# Altium schematic sheet SPSU_3.SchDoc: SPSU
size 292 x 217 mm; PCB_VERSION: V3.0; Origin: Eagle; Date: 12/02/2024 2:33:38 pm; SheetNumber: 4; SCHEMATIC_VERSION: SCHEMATIC_VERSION; GateName_1: G$1; SymbolName_1: A4L-LOC; LibraryName: frames_corvus; DeviceSetName: A4L-LOC; Sheet: Sheet:
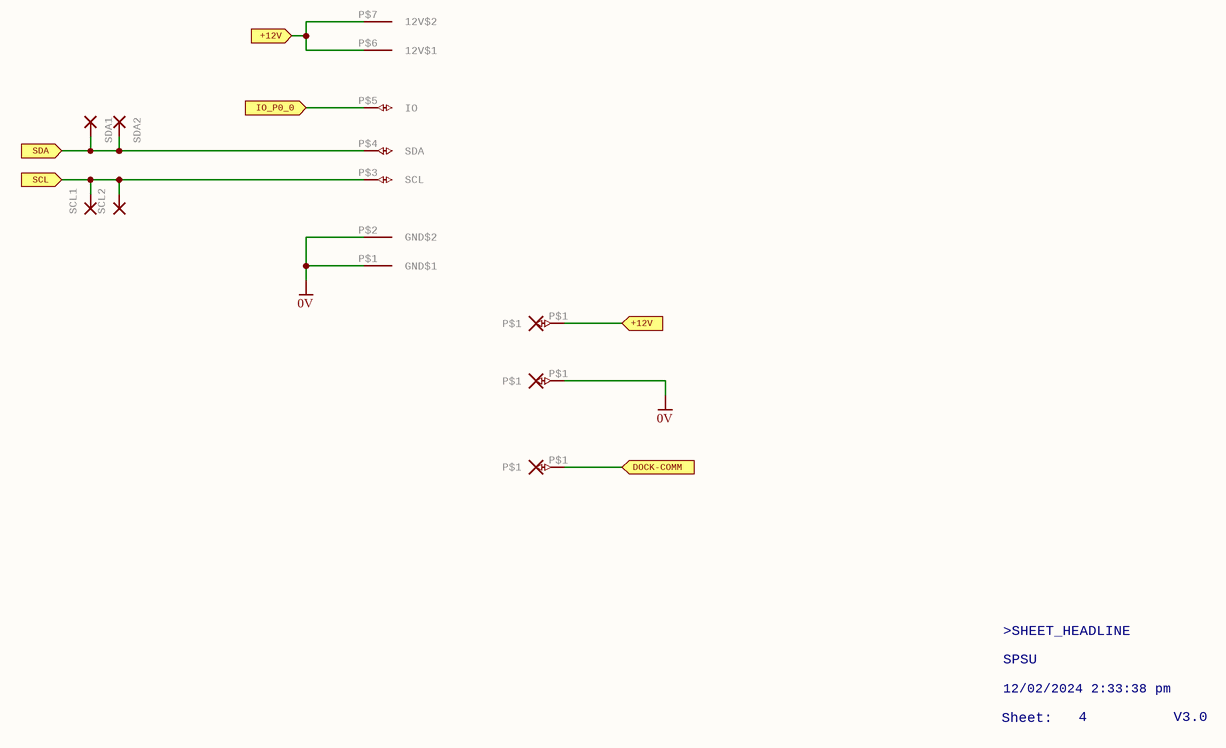
[diagram p0: SPSU_3.SchDoc]

## Parts
CHG+  SMT-PAD_SQ6MM  [SMT-PAD_SQ6MM]  (value not drawn)
CHG-  SMT-PAD_SQ6MM  [SMT-PAD_SQ6MM]  (value not drawn)
SCL1  1,6/0,8  [1,6/0,8]  (value not drawn)
SCL2  1,6/0,8  [1,6/0,8]  (value not drawn)
SDA1  1,6/0,8  [1,6/0,8]  (value not drawn)
SDA2  1,6/0,8  [1,6/0,8]  (value not drawn)
U$1  BATT_CON_THT  [BATT_CON_THT]  (value not drawn)
U$2  SMT-PAD_R3MM  [SMT-PAD_R3MM]  (value not drawn)

## Ports
+12V (in), DOCK-COMM (in), IO_P0_0 (in), SCL (in), SDA (in)

## Nets
0V: CHG-.P$1 U$1.P$1(GND$1) U$1.P$2(GND$2)
+12V: CHG+.P$1 U$1.P$6(12V$1) U$1.P$7(12V$2) ; port +12V
DOCK-COMM: U$2.P$1 ; port DOCK-COMM
IO_P0_0: U$1.P$5(IO) ; port IO_P0_0
SCL: SCL1.1(P) SCL2.1(P) U$1.P$3(SCL) ; port SCL
SDA: SDA1.1(P) SDA2.1(P) U$1.P$4(SDA) ; port SDA

## Notes on the sheet
- >SHEET_HEADLINE
- Sheet:
- SPSU
- 12/02/2024 2:33:38 pm
- 4
- V3.0

## Library data of the parts
CHG+ CHG- = SMT-PAD_SQ6MM: GateName_1: G$1; SymbolName_1: TH; LibraryName: corvus_holes; DeviceSetName: SMT-PAD_SQ6MM
SCL1 SCL2 SDA1 SDA2 = 1,6/0,8: THROUGH-HOLE PAD; GateName_1: P; POPULARITY: 15; SymbolName_1: PAD; LibraryName: wirepad; DeviceSetName: 1,6/0,8
U$1 = BATT_CON_THT: GateName_1: G$1; SymbolName_1: BATT_CON; LibraryName: corvus_parts; DeviceSetName: BATT_CON_THT
U$2 = SMT-PAD_R3MM: GateName_1: G$1; SymbolName_1: TH; LibraryName: corvus_holes; DeviceSetName: SMT-PAD_R3MM